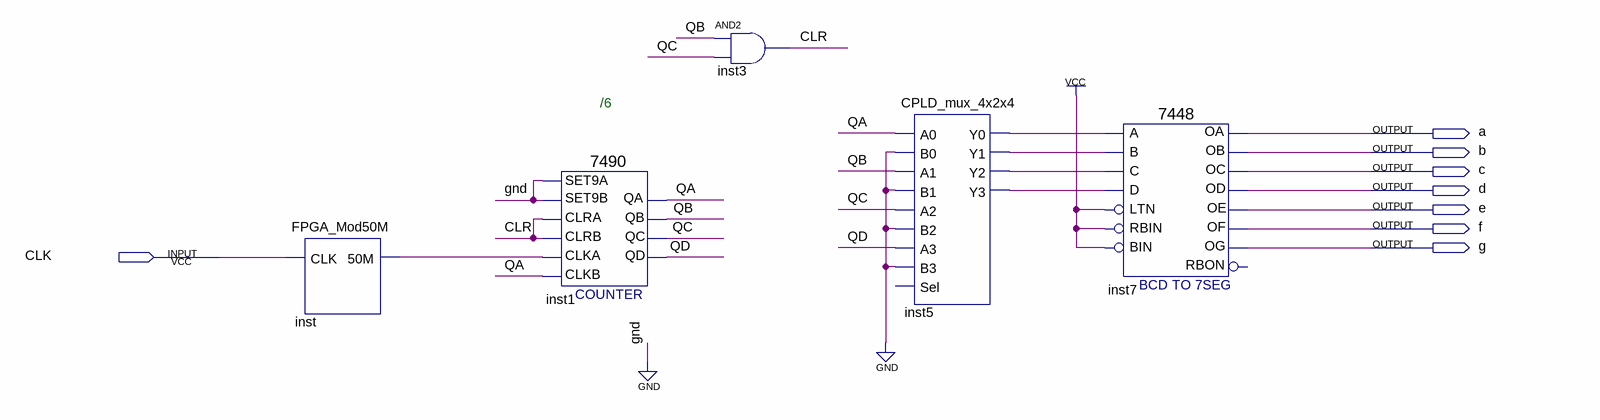
[diagram p0: schematic sheet]
// Quartus schematic FPGA_Dice_7Seg.bdf as structural Verilog: 5 symbols, 8 pins
module FPGA_Dice_7Seg (
  input  CLK,
  output a,
  output b,
  output c,
  output d,
  output e,
  output f,
  output g
);

  wire CLR, inst5_y0, inst5_y1, inst5_y2, inst5_y3, inst_50m, QA, QB, QC, QD;

  FPGA_Mod50M inst (.CLK(CLK), .\50M (inst_50m));
  \7490  inst1 (
    .SET9A(1'b0), .CLRA(CLR), .SET9B(1'b0), .CLKB(QA), .CLKA(inst_50m), .CLRB(CLR), .QD(QD), .QA(QA),
    .QB(QB), .QC(QC));
  and inst3 (CLR, QB, QC);
  CPLD_mux_4x2x4 inst5 (
    .A0(QA), .B0(1'b0), .A1(QB), .B1(1'b0), .A2(QC), .B2(1'b0), .A3(QD), .B3(1'b0), .Y0(inst5_y0),
    .Y1(inst5_y1), .Y2(inst5_y2), .Y3(inst5_y3));  // open: Sel
  \7448  inst7 (
    .A(inst5_y0), .C(inst5_y2), .D(inst5_y3), .B(inst5_y1), .RBIN(1'b1), .BIN(1'b1), .LTN(1'b1), .OC(c),
    .OE(e), .OD(d), .OF(f), .OG(g), .OB(b), .OA(a));  // open: RBON

  // Notes on the sheet:
  //   /6
endmodule
